# Altium schematic sheet 带隙基准.SchDoc
size 1651 x 1651 mm; SheetNumber: 4; SheetTotal: 15
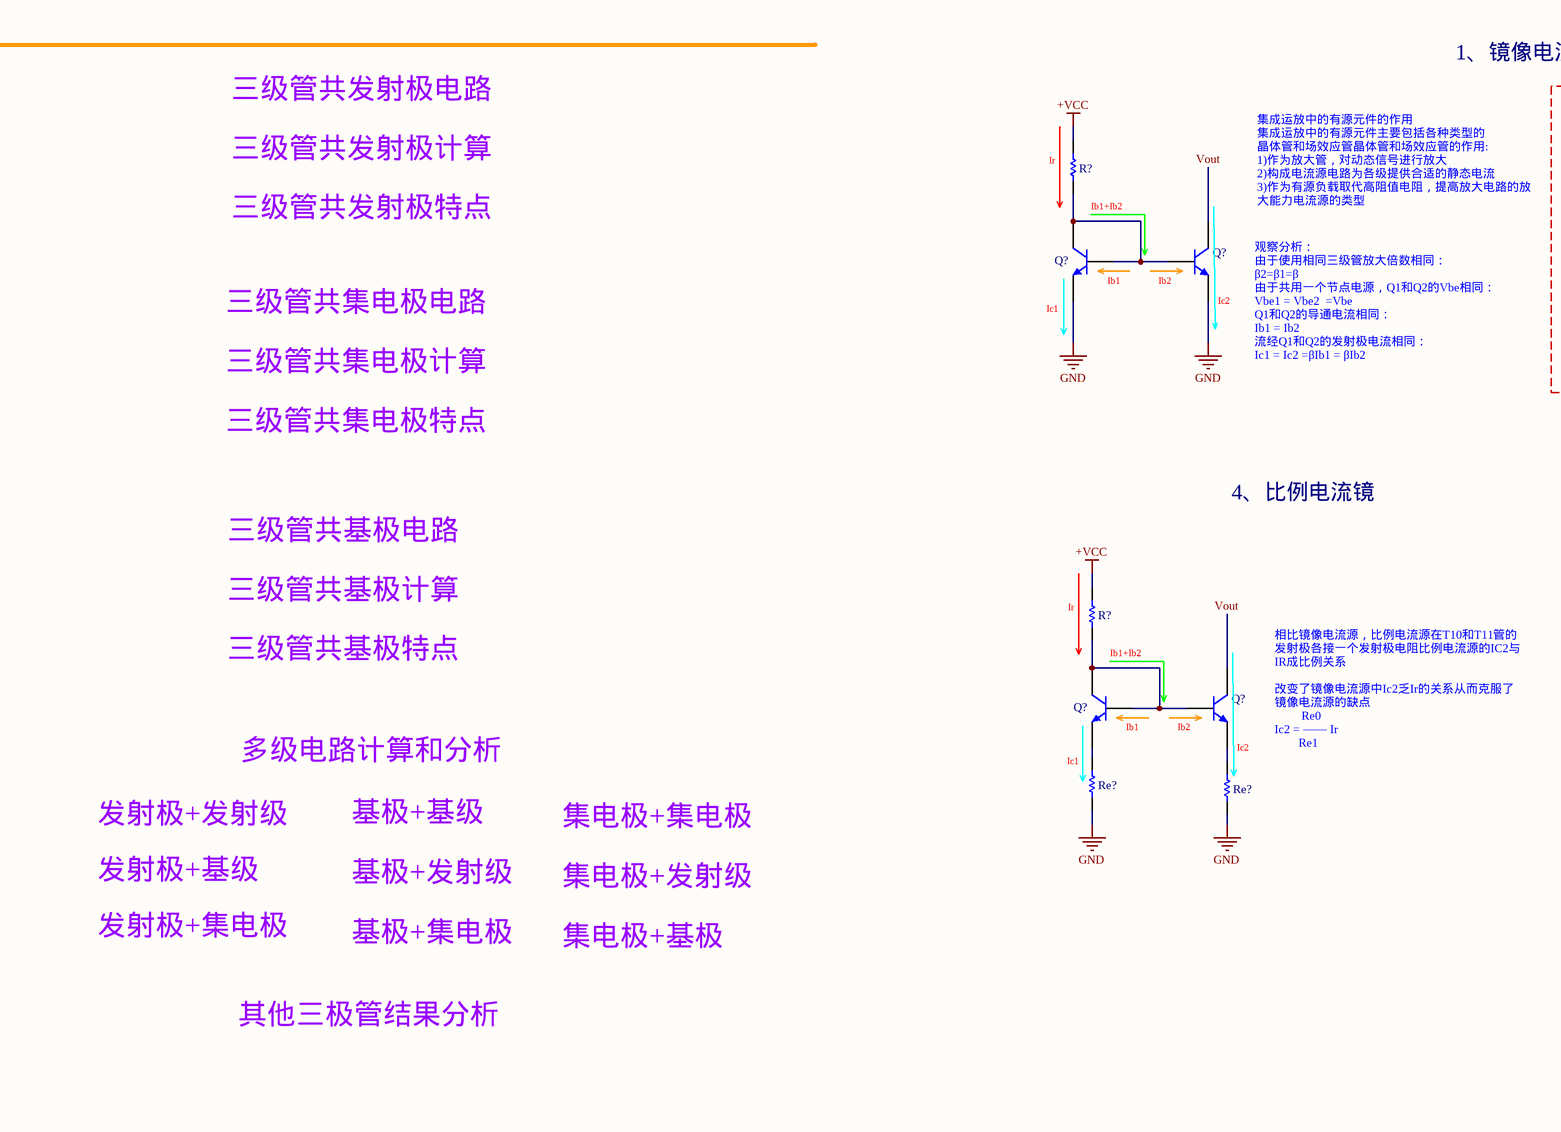
[diagram p0: 带隙基准.SchDoc, top left]
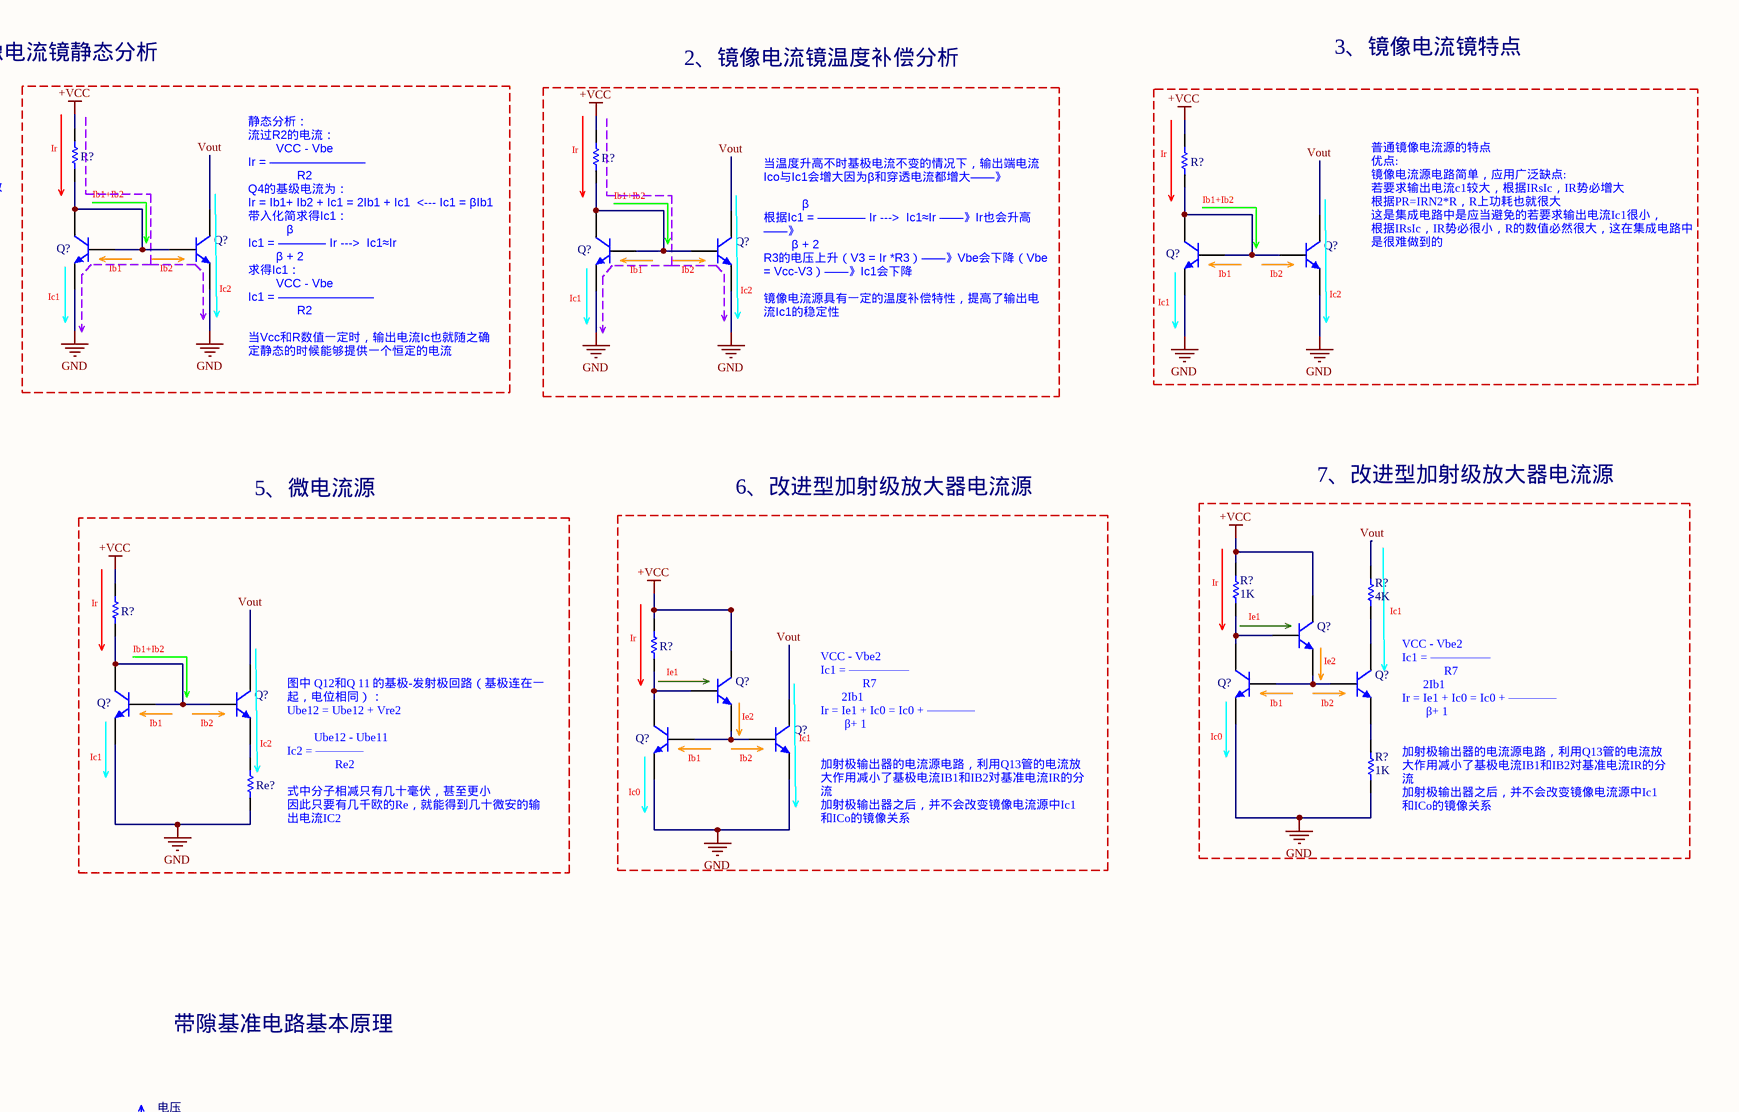
[diagram p1: 带隙基准.SchDoc, top right]
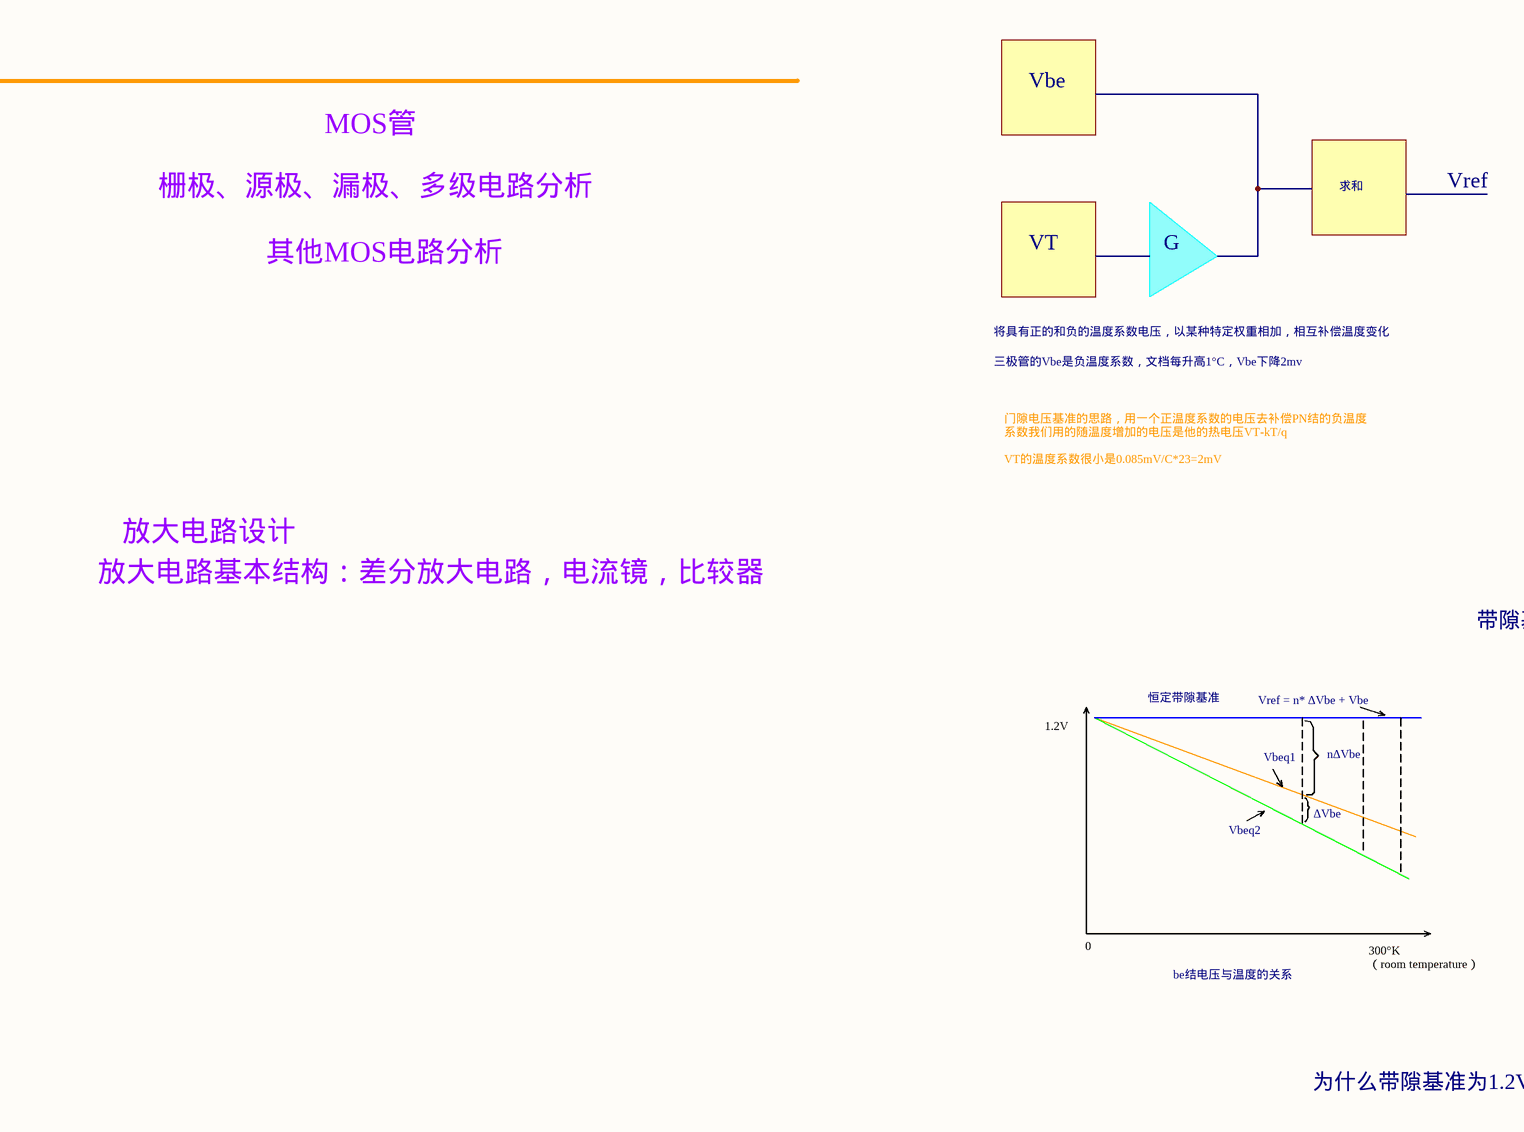
[diagram p2: 带隙基准.SchDoc, bottom left]
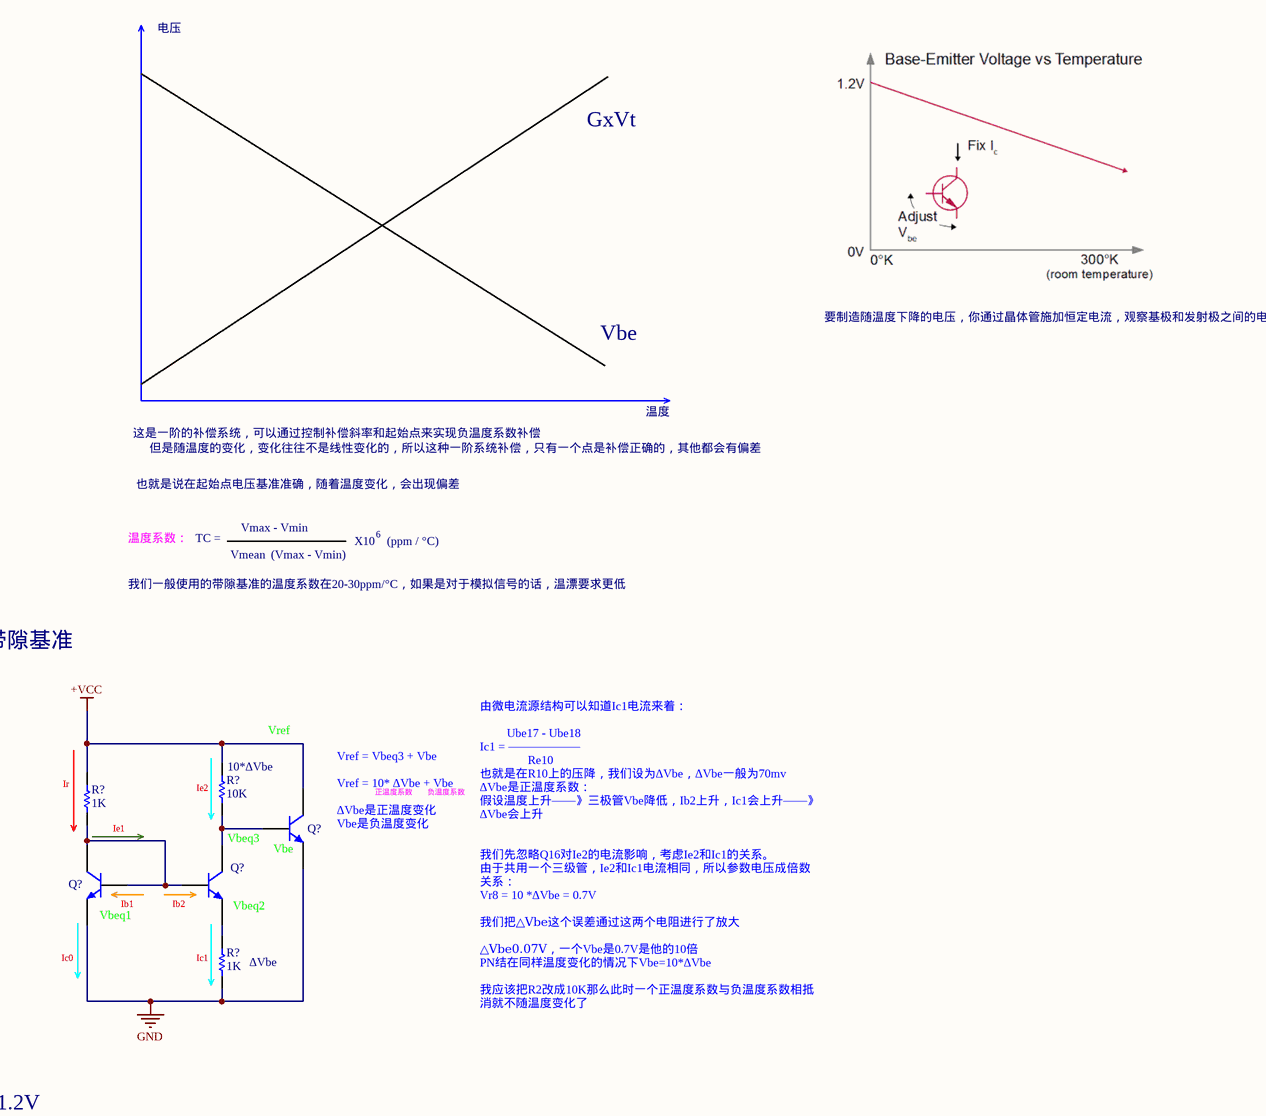
[diagram p3: 带隙基准.SchDoc, bottom right]

## Parts
(Parts that share a designator on the sheet are numbered #1, #2 ... from top to bottom, then left to right.)
Q?#1  Bipolar NPN 3 Pins Transistor VBIC Model  (value not drawn)
Q?#2  Bipolar NPN 3 Pins Transistor VBIC Model  (value not drawn)
Q?#3  Bipolar NPN 3 Pins Transistor VBIC Model  (value not drawn)
Q?#4  Bipolar NPN 3 Pins Transistor VBIC Model  (value not drawn)
Q?#5  Bipolar NPN 3 Pins Transistor VBIC Model  (value not drawn)
Q?#6  Bipolar NPN 3 Pins Transistor VBIC Model  (value not drawn)
Q?#7  Bipolar NPN 3 Pins Transistor VBIC Model  (value not drawn)
Q?#8  Bipolar NPN 3 Pins Transistor VBIC Model  (value not drawn)
Q?#9  Bipolar NPN 3 Pins Transistor VBIC Model  (value not drawn)
Q?#10  Bipolar NPN 3 Pins Transistor VBIC Model  (value not drawn)
Q?#11  Bipolar NPN 3 Pins Transistor VBIC Model  (value not drawn)
Q?#12  Bipolar NPN 3 Pins Transistor VBIC Model  (value not drawn)
Q?#13  Bipolar NPN 3 Pins Transistor VBIC Model  (value not drawn)
Q?#14  Bipolar NPN 3 Pins Transistor VBIC Model  (value not drawn)
Q?#15  Bipolar NPN 3 Pins Transistor VBIC Model  (value not drawn)
Q?#16  Bipolar NPN 3 Pins Transistor VBIC Model  (value not drawn)
Q?#17  Bipolar NPN 3 Pins Transistor VBIC Model  (value not drawn)
Q?#18  Bipolar NPN 3 Pins Transistor VBIC Model  (value not drawn)
Q?#19  Bipolar NPN 3 Pins Transistor VBIC Model  (value not drawn)
Q?#20  Bipolar NPN 3 Pins Transistor VBIC Model  (value not drawn)
Q?#21  Bipolar NPN 3 Pins Transistor VBIC Model  (value not drawn)
R?#1  Resistor  (value not drawn)
R?#2  Resistor  (value not drawn)
R?#3  Resistor  (value not drawn)
R?#4  Resistor  (value not drawn)
R?#5  value 1K  (hidden comment: Resistor)
R?#6  value 4K  (hidden comment: Resistor)
R?#7  Resistor  (value not drawn)
R?#8  Resistor  (value not drawn)
R?#9  Resistor  (value not drawn)
R?#10  value 1K  (hidden comment: Resistor)
R?#11  value 10K  (hidden comment: Resistor)
R?#12  value 1K  (hidden comment: Resistor)
R?#13  value 1K  (hidden comment: Resistor)
Re?#1  Resistor  (value not drawn)
Re?#2  Resistor  (value not drawn)
Re?#3  Resistor  (value not drawn)

## Blocks framed on the sheet
2、镜像电流镜温度补偿分析: Q?#3 Q?#4 R?#2
5、微电流源: Q?#13 Q?#14 R?#7 Re?#3
6、改进型加射级放大器电流源: Q?#12 Q?#17 Q?#18 R?#9
7、改进型加射级放大器电流源: Q?#9-Q?#11 R?#5 R?#6 R?#10

## Nets
+VCC: Q?#9.1(C) Q?#12.1(C) Q?#19.1(C) R?#1.2 R?#2.2 R?#3.2 R?#4.2 R?#5.2 R?#7.2 R?#8.2 R?#9.2 R?#11.2 R?#12.2
GND: Q?#1.3(E) Q?#2.3(E) Q?#3.3(E) Q?#4.3(E) Q?#5.3(E) Q?#6.3(E) Q?#7.3(E) Q?#8.3(E) Q?#10.3(E) Q?#13.3(E) Q?#17.3(E) Q?#18.3(E) Q?#19.3(E) Q?#20.3(E) R?#10.1 R?#13.1 Re?#1.1 Re?#2.1 Re?#3.1
Vout: Q?#2.1(C) Q?#4.1(C) Q?#6.1(C) Q?#8.1(C) Q?#14.1(C) Q?#16.1(C) Q?#18.1(C) R?#6.2
NetQ?#1_1: Q?#1.1(C) Q?#1.2(B) Q?#2.2(B) R?#1.1
NetQ?#3_1: Q?#3.1(C) Q?#3.2(B) Q?#4.2(B) R?#2.1
NetQ?#5_1: Q?#5.1(C) Q?#5.2(B) Q?#6.2(B) R?#3.1
NetQ?#7_1: Q?#7.1(C) Q?#7.2(B) Q?#8.2(B) R?#4.1
NetQ?#9_2: Q?#9.2(B) Q?#10.1(C) R?#5.1
NetQ?#9_3: Q?#9.3(E) Q?#10.2(B) Q?#11.2(B)
NetQ?#11_1: Q?#11.1(C) R?#6.1
NetQ?#11_3: Q?#11.3(E) R?#10.2
NetQ?#12_2: Q?#12.2(B) Q?#17.1(C) R?#9.1
NetQ?#12_3: Q?#12.3(E) Q?#17.2(B) Q?#18.2(B)
NetQ?#13_1: Q?#13.1(C) Q?#13.2(B) Q?#14.2(B) R?#7.1
NetQ?#14_3: Q?#14.3(E) Re?#3.2
NetQ?#15_1: Q?#15.1(C) Q?#15.2(B) Q?#16.2(B) R?#8.1
NetQ?#15_3: Q?#15.3(E) Re?#1.2
NetQ?#16_3: Q?#16.3(E) Re?#2.2
NetQ?#19_2: Q?#19.2(B) Q?#21.1(C) R?#11.1
NetQ?#20_1: Q?#20.1(C) Q?#20.2(B) Q?#21.2(B) R?#12.1
NetQ?#21_3: Q?#21.3(E) R?#13.2

## Notes on the sheet
- 1、镜像电流镜静态分析
- 3、镜像电流镜特点
- 三级管共发射极电路
- 三级管共发射极计算
- (near R?#4) Ir
- (near R?#1) Ir
- Ib1+Ib2
- (near R?#2) Ir
- (near R?#3) Ir
- 三级管共发射极特点
- 集成运放中的有源元件的作用
  集成运放中的有源元件主要包括各种类型的
  晶体管和场效应管晶体管和场效应管的作用:
  1)作为放大管，对动态信号进行放大
  2)构成电流源电路为各级提供合适的静态电流
  3)作为有源负载取代高阻值电阻，提高放大电路的放大能力电流源的类型
- (near Q?#1) Ib1
- (near Q?#2) Ib2
- (near Q?#3) Ib1
- (near Q?#4) Ib2
- 三级管共集电极电路
- (near Q?#7) Ic1
- (near Q?#7) Ib1
- (near Q?#8) Ib2
- (near Q?#8) Ic2
- (near Q?#1) Ic1
- (near Q?#2) Ic2
- (near Q?#3) Ic1
- (near Q?#4) Ic2
- (near Q?#4) 当温度升高不时基极电流不变的情况下，输出端电流Ico与Ic1会增大因为β和穿透电流都增大——》
  β
  根据Ic1 = ———— Ir --->  Ic1≈Ir ——》Ir也会升高——》
  β + 2
  R3的电压上升（V3 = Ir *R3）——》Vbe会下降（Vbe = Vcc-V3）——》Ic1会下降
  镜像电流源具有一定的温度补偿特性，提高了输出电流Ic1的稳定性
- (near Q?#5) Ic1
- (near Q?#5) Ib1
- (near Q?#6) Ib2
- (near Q?#6) Ic2
- (near Q?#6) 普通镜像电流源的特点
  优点:
  镜像电流源电路简单，应用广泛缺点:
  若要求输出电流c1较大，根据IRsIc，IR势必增大
  根据PR=IRN2*R，R上功耗也就很大
  这是集成电路中是应当避免的若要求输出电流Ic1很小，
  根据IRsIc，IR势必很小，R的数值必然很大，这在集成电路中是很难做到的
- 三级管共集电极计算
- (near Q?#8) 观察分析：
  由于使用相同三级管放大倍数相同：
  β2=β1=β
  由于共用一个节点电源，Q1和Q2的Vbe相同：
  Vbe1 = Vbe2  =Vbe
  Q1和Q2的导通电流相同：
  Ib1 = Ib2
  流经Q1和Q2的发射极电流相同：
  Ic1 = Ic2 =βIb1 = βIb2
- (near Q?#2) 静态分析：
  流过R2的电流：
  VCC - Vbe
  Ir = ————————
  R2
  Q4的基级电流为：
  Ir = Ib1+ Ib2 + Ic1 = 2Ib1 + Ic1  <--- Ic1 = βIb1
  带入化简求得Ic1：
  β
  Ic1 = ———— Ir --->  Ic1≈Ir
  β + 2
  求得Ic1：
  VCC - Vbe
  Ic1 = ————————
  R2
  当Vcc和R数值一定时，输出电流Ic也就随之确定静态的时候能够提供一个恒定的电流
- 三级管共集电极特点
- 三级管共基极电路
- 4、比例电流镜
- 三级管共基极计算
- (near R?#8) Ir
- (near R?#7) Ir
- (near R?#5) Ir
- 三级管共基极特点
- (near R?#9) Ir
- (near R?#9) Ie1
- (near R?#5) Ie1
- (near Q?#9) Ie2
- (near R?#6) Ic1
- (near Q?#15) Ib1
- (near Q?#16) Ib2
- (near Q?#13) Ib1
- (near Q?#14) Ib2
- Ic2
- (near Q?#12) Ie2
- (near Q?#18) Ic1
- (near Q?#10) Ic0
- (near Q?#10) Ib1
- (near Q?#11) Ib2
- 多级电路计算和分析
- (near Re?#1) Ic1
- 相比镜像电流源，比例电流源在T10和T11管的发射极各接一个发射极电阻比例电流源的IC2与IR成比例关系
  改变了镜像电流源中Ic2乏Ir的关系从而克服了镜像电流源的缺点
  Re0
  Ic2 = —— Ir
  Re1
- (near Q?#13) Ic1
- (near Q?#17) Ic0
- (near Q?#17) Ib1
- (near Q?#18) Ib2
- 发射极+发射级
- 基极+基级
- 集电极+集电极
- 图中 Q12和Q 11 的基极-发射极回路（基极连在一起，电位相同）：
  Ube12 = Ube12 + Vre2
  Ube12 - Ube11
  Ic2 = ————
  Re2
  式中分子相减只有几十毫伏，甚至更小
  因此只要有几千欧的Re，就能得到几十微安的输出电流IC2
- (near Q?#18) VCC - Vbe2
  Ic1 = —————
  R7
  2Ib1
  Ir = Ie1 + Ic0 = Ic0 + ————
  β+ 1
  加射极输出器的电流源电路，利用Q13管的电流放大作用减小了基极电流IB1和IB2对基准电流IR的分流
  加射极输出器之后，并不会改变镜像电流源中Ic1和ICo的镜像关系
- VCC - Vbe2
  Ic1 = —————
  R7
  2Ib1
  Ir = Ie1 + Ic0 = Ic0 + ————
  β+ 1
  加射极输出器的电流源电路，利用Q13管的电流放大作用减小了基极电流IB1和IB2对基准电流IR的分流
  加射极输出器之后，并不会改变镜像电流源中Ic1和ICo的镜像关系
- 发射极+基级
- 发射极+集电极
- 基极+发射级
- 基极+集电极
- 集电极+发射级
- 集电极+基极
- 其他三极管结果分析
- 带隙基准电路基本原理
- 电压
- Vbe
- GxVt
- MOS管
- 栅极、源极、漏极、多级电路分析
- VT
- G
- 求和
- Vref
- 其他MOS电路分析
- 要制造随温度下降的电压，你通过晶体管施加恒定电流，观察基极和发射极之间的电压，称为VBE
- 将具有正的和负的温度系数电压，以某种特定权重相加，相互补偿温度变化
- 三极管的Vbe是负温度系数，文档每升高1°C，Vbe下降2mv
- 这是一阶的补偿系统，可以通过控制补偿斜率和起始点来实现负温度系数补偿
- 但是随温度的变化，变化往往不是线性变化的，所以这种一阶系统补偿，只有一个点是补偿正确的，其他都会有偏差
- 温度
- 门隙电压基准的思路，用一个正温度系数的电压去补偿PN结的负温度系数我们用的随温度增加的电压是他的热电压VT-kT/q
  VT的温度系数很小是0.085mV/C*23=2mV
- 温度系数：
- 也就是说在起始点电压基准准确，随着温度变化，会出现偏差
- TC =
- Vmax - Vmin
- 6
- 放大电路基本结构：差分放大电路，电流镜，比较器
- 放大电路设计
- 我们一般使用的带隙基准的温度系数在20-30ppm/°C，如果是对于模拟信号的话，温漂要求更低
- Vmean
- (Vmax - Vmin)
- X10
- (ppm / °C)
- 带隙基准
- 恒定带隙基准
- Vref = n* ∆Vbe + Vbe
- 1.2V
- Vbeq1
- n∆Vbe
- (near R?#12) Ir
- (near R?#11) Ie2
- (near R?#11) 10*∆Vbe
- 正温度系数
- 负温度系数
- Vbeq2
- ∆Vbe
- Ie1
- Vbeq3
- (near Q?#19) Vbe
- (near Q?#19) Vref = Vbeq3 + Vbe
  Vref = 10* ∆Vbe + Vbe
  ∆Vbe是正温度变化
  Vbe是负温度变化
- (near Q?#20) Vbeq1
- (near Q?#20) Ib1
- (near Q?#21) Ib2
- (near Q?#21) Vbeq2
- 0
- be结电压与温度的关系
- 300°K
  （room temperature）
- Ic0
- (near R?#13) Ic1
- (near R?#13) ∆Vbe
- 由微电流源结构可以知道Ic1电流来着：
  Ube17 - Ube18
  Ic1 = ——————
  Re10
  也就是在R10上的压降，我们设为∆Vbe，∆Vbe一般为70mv
  ∆Vbe是正温度系数：
  假设温度上升——》三极管Vbe降低，Ib2上升，Ic1会上升——》∆Vbe会上升
  我们先忽略Q16对Ie2的电流影响，考虑Ie2和Ic1的关系。
  由于共用一个三级管，Ie2和Ic1电流相同，所以参数电压成倍数关系：
  Vr8 = 10 *∆Vbe = 0.7V
  我们把△Vbe这个误差通过这两个电阻进行了放大
  △Vbe0.07V，一个Vbe是0.7V是他的10倍
  PN结在同样温度变化的情况下Vbe=10*∆Vbe
  我应该把R2改成10K那么此时一个正温度系数与负温度系数相抵消就不随温度变化了
- 为什么带隙基准为1.2V

## Library data of the parts
Q?#1-Q?#21 = BJT NPN VBIC: SimulationGenericComponent: True; AFN: 1; AJC: -0.5; ART: 0.1; AVC1: 0; EA: 1.12; FC: 0.9; IBBE: 1e-06; IBCI: 1e-16; IBEI: 1e-18; MC: 0.33; NCN: 2; NKF: 0.5; PC: 0.75; TNOM: 27; VERS: 1.2; XII: 3; AJE: -0.5; AJS: -0.5; AVC2: 0; BFN: 1; CBCO: 0; CBEO: 0; CCSO: 0; CJC: 0; CJCP: 0; CJE: 0; CJEP: 0; CTH: 0; DEAR: 0; EAIC: 1.12; EAIE: 1.12; EAIS: 1.12; EANC: 1.12; EANE: 1.12; EANS: 1.12; EAP: 1.12; EBBE: 0; GAMM: 0; HRCF: 1; IBCIP: 0; IBCN: 0; IBCNP: 0; IBEIP: 0; IBEN: 0; IBENP: 0; IKF: 0; IKP: 0; IKR: 0; IS: 1e-16; ISP: 0; ISRR: 1; ITF: 0; KFN: 0; ME: 0.33; MS: 0.33; NBBE: 1; NCI: 1; NCIP: 1; NCNP: 2; NEI: 1; NEN: 2; NF: 1; NFP: 1; NR: 1; PE: 0.75; PS: 0.75; QBM: 0; QCO: 0; QTF: 0; RBI: 0.1; RBP: 0.1; RBX: 0; RCI: 0.1; RCX: 0; RE: 0; RS: 0; RTH: 0; TAVC: 0; TD: 0; TF: 0; TNBBE: 0; TNF: 0; TR: 0; TVBBE1: 0; TVBBE2: 0; VBBE: 0; VEF: 0; VER: 0; VO: 0; VREF: 0; VRT: 0; VTF: 0; WBE: 1; WSP: 1; XIKF: 0; XIN: 3; XIS: 3; XISR: 0; XRBI: 0; XRBP: 0; XRBX: 0; XRCI: 0; XRCX: 0; XRE: 0; XRS: 0; XTF: 0; XVO: 0
R?#1-R?#13 Re?#1-Re?#3 = Resistor: TC1: 0; SimulationGenericComponent: True; TC2: 0